# Altium schematic sheet PSOC_I2C_BUS.SchDoc
size A3; SheetNumber: 4; SheetTotal: 7
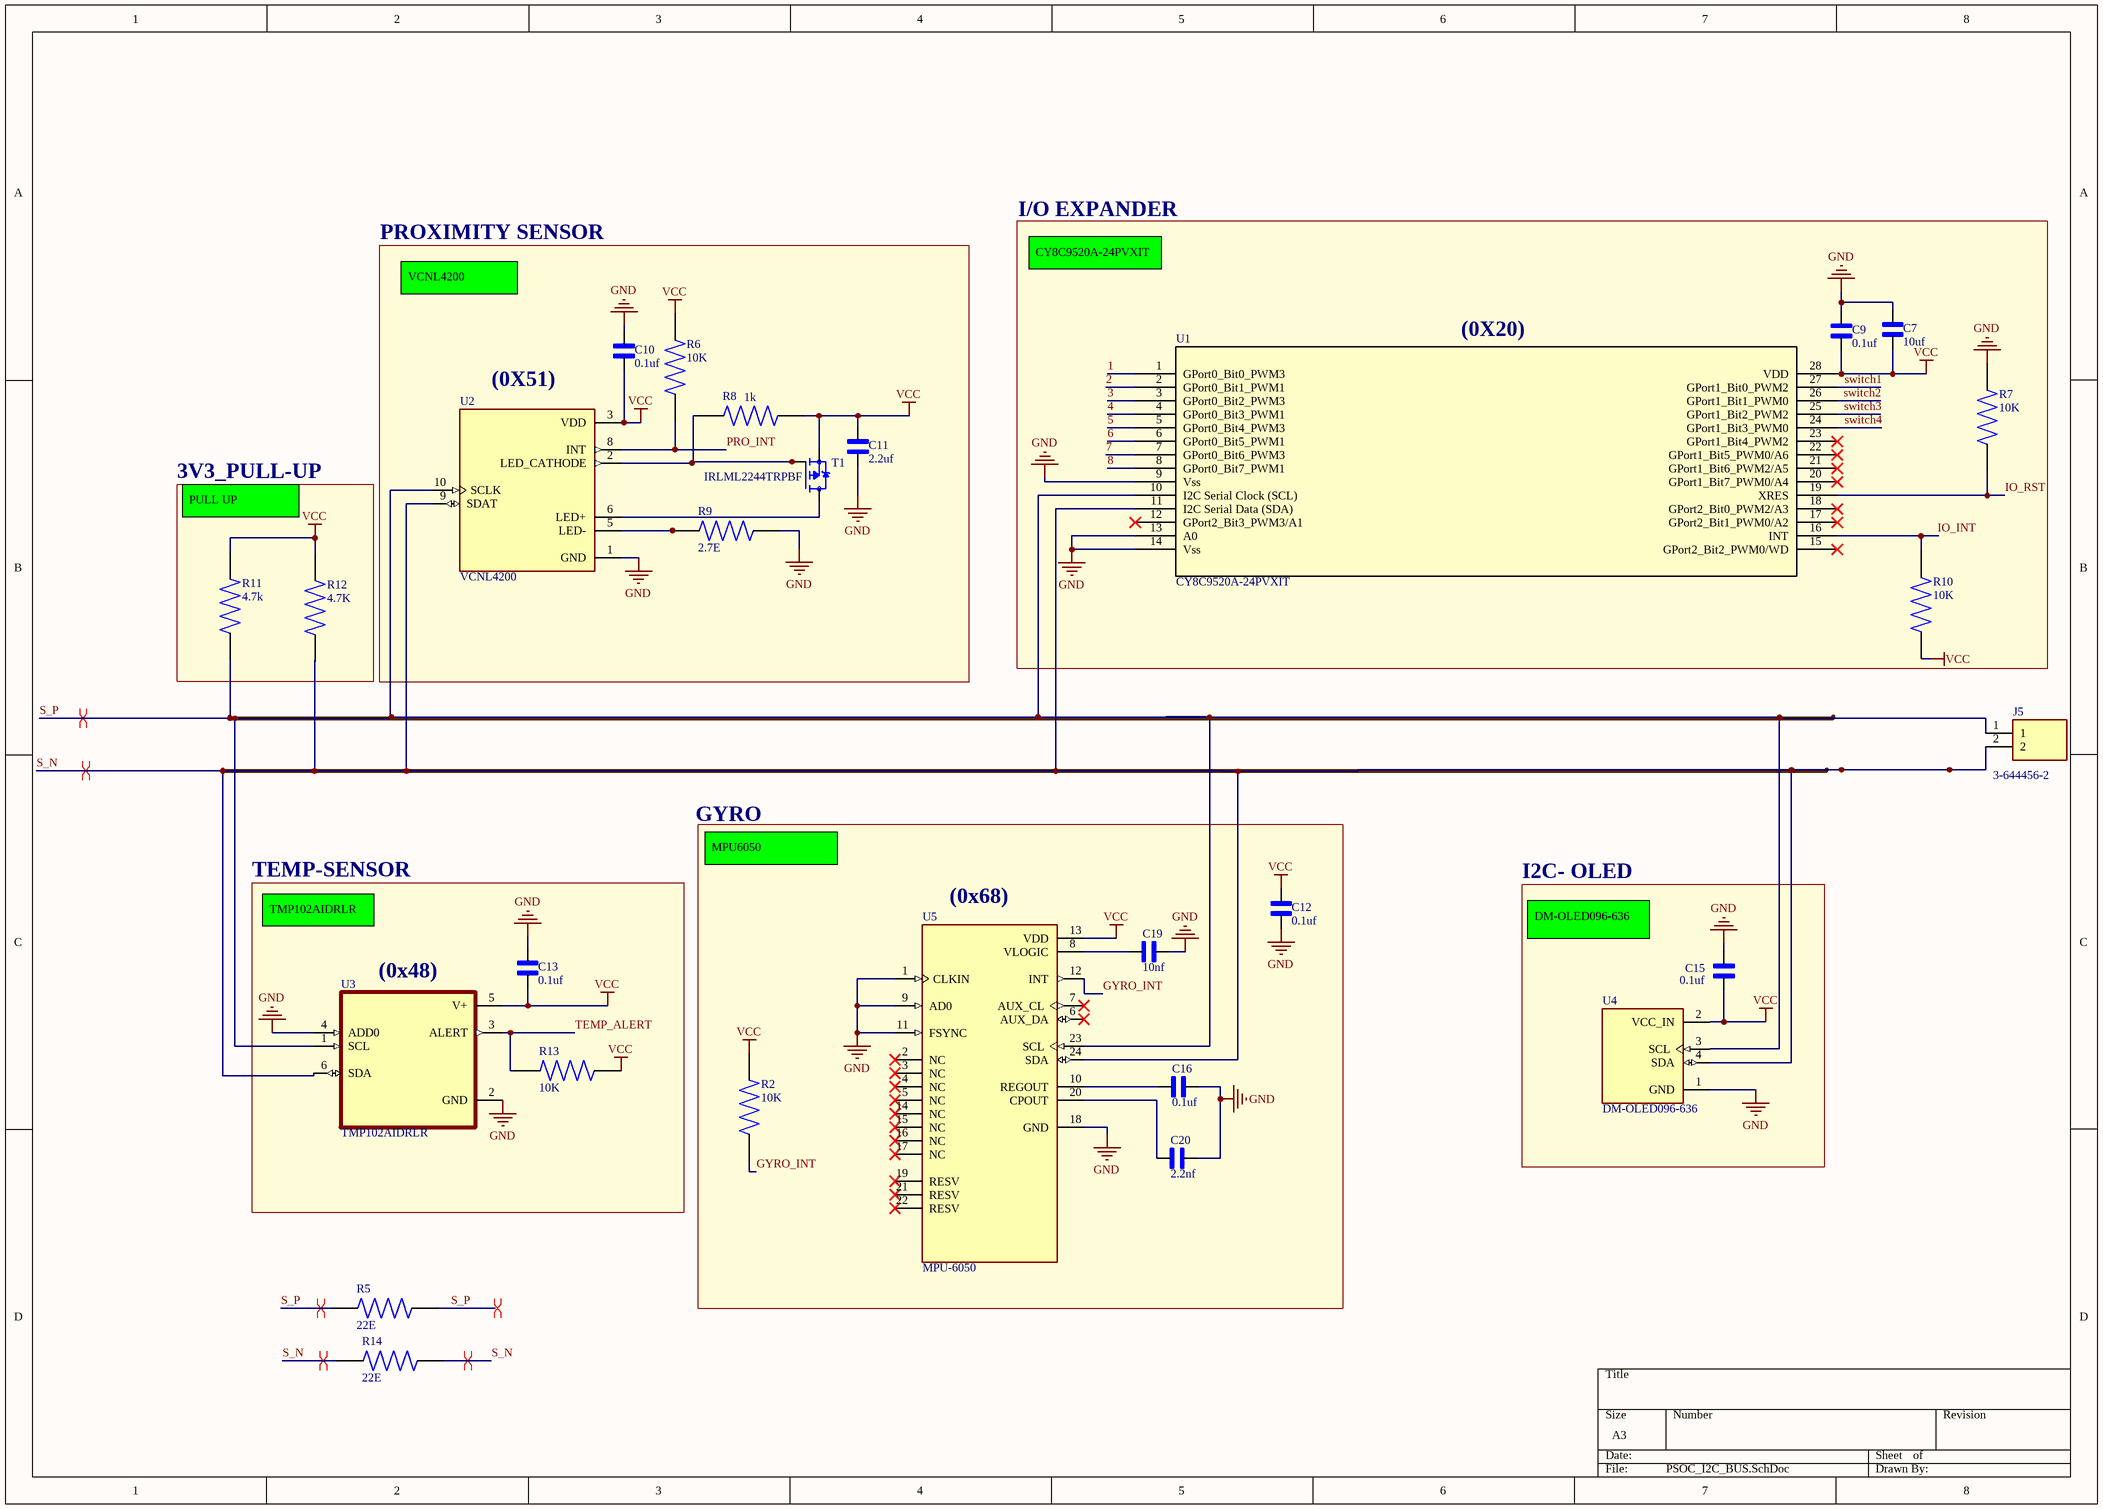
[diagram p0: PSOC_I2C_BUS.SchDoc]

## Parts
C7  10uf  [CAPC3216X229N]
C9  0.1uf  [CAPC1005X55N]
C10  0.1uf  [CAPC1005X55N]
C11  2.2uf  [CAPC1005X55N]
C12  0.1uf  [CAPC1005X55N]
C13  0.1uf  [CAPC1005X55N]
C15  0.1uf  [CAPC1005X55N]
C16  0.1uf  [CAPC1005X55N]
C19  10nf  [CAPC1005X55N]
C20  2.2nf  [CAPC1005X55N]
J5  3-644456-2  [TE_3-644456-2]
R2  10K  [RESC1005X40N]
R5  22E  [RESC1005X40N]
R6  10K  [RESC1005X40N]
R7  10K  [RESC1005X40N]
R8  1k  [RESC1005X40N]
R9  2.7E  [RESC1005X40N]
R10  10K  [RESC1005X40N]
R11  4.7k  [RESC1005X40N]
R12  4.7K  [RESC1005X40N]
R13  10K  [RESC1005X40N]
R14  22E  [RESC1005X40N]
T1  IRLML2244TRPBF  [SOT-23]
U1  CY8C9520A-24PVXIT  [SSOP-28]
U2  VCNL4200  [SENSOR_VCNL4200]
U3  TMP102AIDRLR  [SOT50P160X60-6N]
U4  DM-OLED096-636  [MODULE_DM-OLED096-636]
U5  MPU-6050  [QFN50P400X400X95-24N]

## Blocks framed on the sheet
3V3_PULL-UP: R11 R12
I2C- OLED: C15 U4

## Nets
GND: C7.2 C9.1 C10.1 C11.2 C12.1 C13.1 C15.1 C16.2 C19.2 C20.2 R7.2 R9.2 U1.9(Vss) U1.13(A0) U1.14(Vss) U2.1(GND) U3.2(GND) U3.4(ADD0) U4.1(GND) U5.1(CLKIN) U5.9(AD0) U5.11(FSYNC) U5.18(GND)
VCC: C7.1 C9.2 C10.2 C11.1 C12.2 C13.2 C15.2 R2.2 R6.2 R8.2 R10.1 R11.2 R12.2 R13.2 T1.2(S) U1.28(VDD) U2.3(VDD) U3.5(V+) U4.2(VCC_IN) U5.13(VDD)
1: U1.1(GPort0_Bit0_PWM3)
2: U1.2(GPort0_Bit1_PWM1)
3: U1.3(GPort0_Bit2_PWM3)
4: U1.4(GPort0_Bit3_PWM1)
5: U1.5(GPort0_Bit4_PWM3)
6: U1.6(GPort0_Bit5_PWM1)
7: U1.7(GPort0_Bit6_PWM3)
8: U1.8(GPort0_Bit7_PWM1)
GYRO_INT: R2.1 U5.12(INT)
IO_INT: R10.2 U1.16(INT)
IO_RST: R7.1 U1.19(XRES)
PRO_INT: R6.1 U2.8(INT)
S_N: J5.2 R12.1 R14.1 R14.2 U1.11(I2C_Serial_Data_(SDA)) U2.9(SDAT) U3.6(SDA) U4.4(SDA) U5.24(SDA)
S_P: J5.1 R5.1 R5.2 R11.1 U1.10(I2C_Serial_Clock_(SCL)) U2.10(SCLK) U3.1(SCL) U4.3(SCL) U5.23(SCL)
switch1: U1.27(GPort1_Bit0_PWM2)
switch2: U1.26(GPort1_Bit1_PWM0)
switch3: U1.25(GPort1_Bit2_PWM2)
switch4: U1.24(GPort1_Bit3_PWM0)
TEMP_ALERT: R13.1 U3.3(ALERT)
NetC16_1: C16.1 U5.10(REGOUT)
NetC19_1: C19.1 U5.8(VLOGIC)
NetC20_1: C20.1 U5.20(CPOUT)
NetR8_1: R8.1 T1.1(G) U2.2(LED_CATHODE)
NetR9_1: R9.1 U2.5(LED-)
NetT1_3: T1.3(D) U2.6(LED+)

Not connected (* = marked no-connect by the designer): U1 12(GPort2_Bit3_PWM3/A1)* 15(GPort2_Bit2_PWM0/WD)* 17(GPort2_Bit1_PWM0/A2)* 18(GPort2_Bit0_PWM2/A3)* 20(GPort1_Bit7_PWM0/A4)* 21(GPort1_Bit6_PWM2/A5)* 22(GPort1_Bit5_PWM0/A6)* 23(GPort1_Bit4_PWM2)*; U5 2(NC)* 3(NC)* 4(NC)* 5(NC)* 6(AUX_DA)* 7(AUX_CL)* 14(NC)* 15(NC)* 16(NC)* 17(NC)* 19(RESV)* 21(RESV)* 22(RESV)*

## Layout directives
differential pair: S_N, S_P

## Notes on the sheet
- PROXIMITY SENSOR
- I/O EXPANDER
- VCNL4200
- CY8C9520A-24PVXIT
- (near U1) (0X20)
- (near U2) (0X51)
- PULL UP
- GYRO
- TEMP-SENSOR
- TMP102AIDRLR
- MPU6050
- (near U5) (0x68)
- (near U3) (0x48)
- DM-OLED096-636

## Library data of the parts
C7 = 1206ZD226MAT2A: 0,1 ÂµF Â±%10 16V Seramik KondansatÃ¶r X7R 0402 (1005 Metrik); MF: AVX; SnapEDA_Link: https://www.snapeda.com/parts/1206ZD226MAT2A/AVX/view-part/?ref=snap; Package: 3216 AVX; Value: *; MP: 1206ZD226MAT2A; Check_prices: https://www.snapeda.com/parts/1206ZD226MAT2A/AVX/view-part/?ref=eda
C9-C13 C15 C16 C19 C20 = C0402T104K4RACTU: Cap Ceramic 0.1uF 16V X7R 10% SMD 0402 85Â°C Punched Paper T/R; MF: KEMET; SnapEDA_Link: https://www.snapeda.com/parts/C0402T104K4RACTU/KEMET/view-part/?ref=snap; Package: 0402 KEMET; Value: *; MP: C0402T104K4RACTU; Check_prices: https://www.snapeda.com/parts/C0402T104K4RACTU/KEMET/view-part/?ref=eda
J5 = 3-644456-2: HEADER ASSEMBLY, NARROW, MTA-100, 2 POSITION, STRAIGHT | TE Connectivity 3-644456-2; SnapEDA_Link: https://www.snapeda.com/parts/3-644456-2/TE+Connectivity+AMP+Connectors/view-part/?ref=snap; Package: None; Value: *; MF: TE Connectivity; MP: 3-644456-2; Check_prices: https://www.snapeda.com/parts/3-644456-2/TE+Connectivity+AMP+Connectors/view-part/?ref=eda
R2 R5-R14 = RL0402FR-070R1L: 100 mOhms Â±1% 0.063W, 1/16W Chip Resistor 0402 (1005 Metric) Automotive AEC-Q200, Current Sense, Moisture Resistant Thick Film; MF: Yageo; SnapEDA_Link: https://www.snapeda.com/parts/RL0402FR-070R1L/Yageo/view-part/?ref=snap; Package: 0402-2 Yageo; Value: *; MP: RL0402FR-070R1L; Check_prices: https://www.snapeda.com/parts/RL0402FR-070R1L/Yageo/view-part/?ref=eda
T1 = IRLML2244TRPBF: IRLML2244TRPBF P-channel MOSFET Transistor, 4.3 A, 20 V, 3-Pin SOT-23 | Infineon IRLML2244TRPBF; SnapEDA_Link: https://www.snapeda.com/parts/IRLML2244TRPBF/Infineon+Technologies/view-part/?ref=snap; Package: SOT-23-3 ON Semiconductor; Value: *; MF: Infineon; MP: IRLML2244TRPBF; Check_prices: https://www.snapeda.com/parts/IRLML2244TRPBF/Infineon+Technologies/view-part/?ref=eda
U1 = CY8C9520A-24PVXIT: Description; Manufacturer_Name: Cypress Semiconductor; Copyright: Copyright (C) 2026 Ultra Librarian. All rights reserved.; Manufacturer_Part_Number: CY8C9520A-24PVXIT; RefDes: RefDes; Type: Type
U2 = VCNL4200: Optical Sensor Ambient 550nm IÂ²C 10-SMD Module; MF: Vishay Semiconductor; SnapEDA_Link: https://www.snapeda.com/parts/VCNL4200/Vishay%20Semiconductor%20Opto%20Division/view-part/1174507/?ref=snap; Availability: Unavailable; MP: VCNL4200; Price: None; Value: *; Package: SMD-10 Vishay
U3 = TMP102AIDRLR: 2C digital temperature sensor, I2C/SMBus in 2.56mm2 package; MF: Texas Instruments; Check_prices: https://www.snapeda.com/parts/TMP102AIDRLR/Texas+Instruments/view-part/?ref=eda; Value: *; Availability: In Stock; MP: TMP102AIDRLR; Price: None; Package: SOT-5X3-6 Texas Instruments; SnapEDA_Link: https://www.snapeda.com/parts/TMP102AIDRLR/Texas+Instruments/view-part/?ref=snap; Purchase-URL: https://pricing.snapeda.com/search/part/TMP102AIDRLR/?ref=eda
U4 = DM-OLED096-636: 0.96â€ 128 X 64 MONOCHROME GRAPHIC OLED DISPLAY MODULE - I2C; SnapEDA_Link: https://www.snapeda.com/parts/DM-OLED096-636/Display+Module/view-part/?ref=snap; Package: Package; Value: *; MF: Display Module; MP: DM-OLED096-636; Check_prices: https://www.snapeda.com/parts/DM-OLED096-636/Display+Module/view-part/?ref=eda
U5 = MPU-6050: MPU-6050 series Accelerometer, Gyroscope, 3 Axis Sensor Evaluation Board; MF: TDK InvenSense; SnapEDA_Link: https://www.snapeda.com/parts/MPU-6050/TDK+InvenSense/view-part/?ref=snap; Package: QFN-24 InvenSense; Value: *; MP: MPU-6050; Check_prices: https://www.snapeda.com/parts/MPU-6050/TDK+InvenSense/view-part/?ref=eda